# Altium schematic sheet Charger.SchDoc
size A4; Organization: Altium Limited; Address1: L3, 12a Rodborough Rd; Address2: Frenchs Forest; Address3: NSW; Address4: Australia 2086
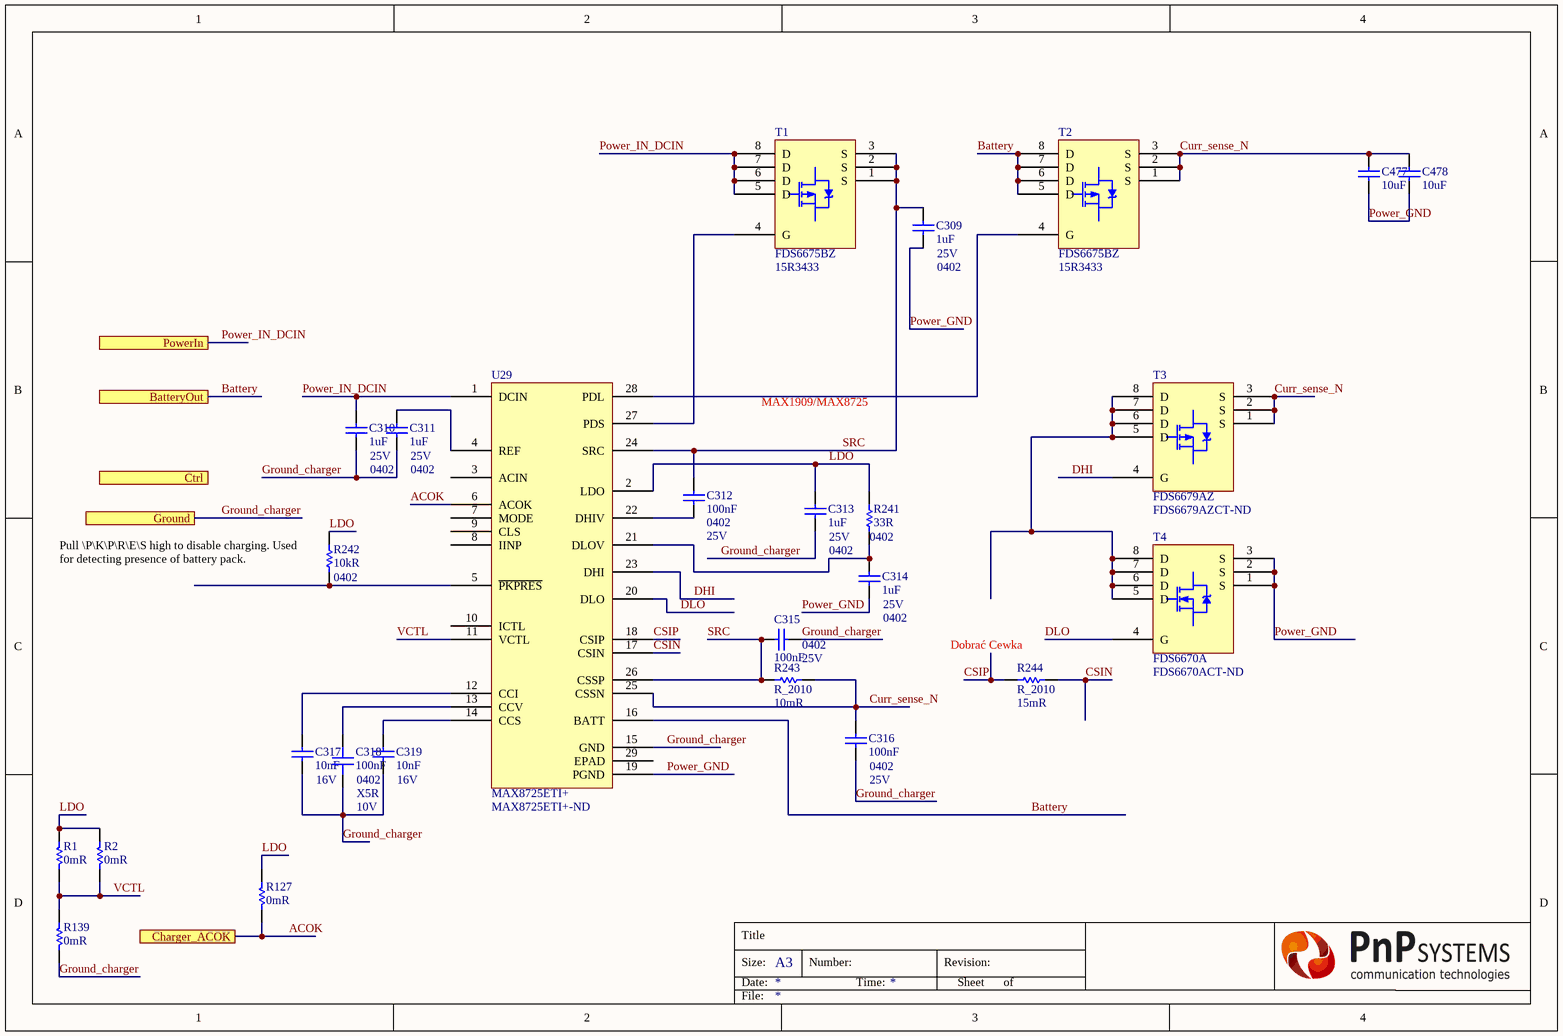
[diagram p0: Charger.SchDoc]

## Parts
C309  1uF  Case/Package: 0402  Voltage Rating: 25V  [CAP 0402/1005 RF]
C310  1uF  Case/Package: 0402  Voltage Rating: 25V  [CAP 0402/1005 RF]
C311  1uF  Case/Package: 0402  Voltage Rating: 25V  [CAP 0402/1005 RF]
C312  100nF  Case/Package: 0402  Voltage Rating: 25V  [CAP 0402/1005 RF]
C313  1uF  Case/Package: 0402  Voltage Rating: 25V  [CAP 0402/1005 RF]
C314  1uF  Case/Package: 0402  Voltage Rating: 25V  [CAP 0402/1005 RF]
C315  100nF  Case/Package: 0402  Voltage Rating: 25V  [CAP 0402/1005 RF]
C316  100nF  Case/Package: 0402  Voltage Rating: 25V  [CAP 0402/1005 RF]
C317  10nF  Voltage Rating (DC): 16V  [CAP 0201/0603 RF]
C318  100nF  Case/Package: 0402  Dielectric: X5R  Voltage Rating: 10V  [CAP 0402/1005 RF]
C319  10nF  Voltage Rating (DC): 16V  [CAP 0201/0603 RF]
C477  10uF  [CAP 1206/3216]
C478  10uF  [CAP 1206/3216]
R1  0mR  [RES 0402/1005 RF]
R2  0mR  [RES 0402/1005 RF]
R127  0mR  [RES 0402/1005 RF]
R139  0mR  [RES 0402/1005 RF]
R241  33R  Case/Package: 0402  [RES 0402/1005 RF]
R242  10kR  Case Code (Imperial): 0402  [RES 0402/1005 RF]
R243  R_2010  Parameter 1: 10mR  [RESC2010]
R244  R_2010  Parameter 1: 15mR  [RESC2010]
T1  FDS6675BZ  Supplier Part Number 1: 15R3433  [FDS6679AZ]
T2  FDS6675BZ  Supplier Part Number 1: 15R3433  [FDS6679AZ]
T3  FDS6679AZ  Supplier Part Number 1: FDS6679AZCT-ND  [FDS6679AZ]
T4  FDS6670A  Supplier Part Number 1: FDS6670ACT-ND  [FDS6679AZ]
U29  MAX8725ETI+  Supplier Part Number 1: MAX8725ETI+-ND  [MAX8725]

## Ports
BatteryOut, Charger_ACOK, Ctrl, Ground, PowerIn

## Nets
ACOK: R127.2 U29.6(ACOK) ; port Charger_ACOK
Battery: T2.5(D) T2.6(D) T2.7(D) T2.8(D) U29.16(BATT) ; port BatteryOut
CSIN: R244.1 U29.17(CSIN)
CSIP: R244.2 U29.18(CSIP)
Curr_sense_N: C316.2 C477.2 C478.2 R243.2 T2.1(S) T2.2(S) T2.3(S) T3.1(S) T3.2(S) T3.3(S) U29.25(CSSN)
DHI: T3.4(G) U29.23(DHI)
DLO: T4.4(G) U29.20(DLO)
Ground_charger: C310.1 C311.1 C313.1 C315.1 C316.1 C317.1 C318.1 C319.1 R139.2 U29.15(GND) ; port Ground
LDO: C313.2 R1.1 R2.1 R127.1 R241.2 R242.2 U29.2(LDO)
Power_GND: C309.1 C314.1 C477.1 C478.1 T4.1(S) T4.2(S) T4.3(S) U29.19(PGND)
Power_IN_DCIN: C310.2 T1.5(D) T1.6(D) T1.7(D) T1.8(D) U29.1(DCIN) ; port PowerIn
SRC: C309.2 C312.1 C315.2 R243.1 T1.1(S) T1.2(S) T1.3(S) U29.24(SRC) U29.26(CSSP)
VCTL: R1.2 R2.2 R139.1 U29.11(VCTL)
NetC311_2: C311.2 U29.4(REF)
NetC312_2: C312.2 U29.22(DHIV)
NetC314_2: C314.2 R241.1 U29.21(DLOV)
NetC317_2: C317.2 U29.12(CCI)
NetC318_2: C318.2 U29.13(CCV)
NetC319_2: C319.2 U29.14(CCS)
NetR242_1: R242.1 U29.5(~{PKPRES})
NetT1_4: T1.4(G) U29.27(PDS)
NetT2_4: T2.4(G) U29.28(PDL)
NetT3_5: T3.5(D) T3.6(D) T3.7(D) T3.8(D) T4.5(D) T4.6(D) T4.7(D) T4.8(D)

Not connected (* = marked no-connect by the designer): U29 3(ACIN) 7(MODE) 8(IINP) 9(CLS) 10(ICTL) 29(EPAD)

## Notes on the sheet
- MAX1909/MAX8725
- (near R242) Pull \P\K\P\R\E\S high to disable charging. Used for detecting presence of battery pack.
- (near R244) Dobrać Cewka
- Title
- Size:
- Date:
- A3
- Number:
- Time:
- Revision:
- Sheet
- of
- File:

## Library data of the parts
C309-C311 C313 C314 = Capacitor: MURATA - GRT155R61E105KE01D - SMD Multilayer Ceramic Capacitor, 1 µF, 25 V, 0402 [1005 Metric], ± 10%, X5R, GRT Series - SMD Multilayer Ceramic Capacitor, 1 µF, 25 V, 0402 [1005 Metric], ± 10%, X5R, GRT Series; Supplier 1: Digi-Key; Supplier Part Number 1: 490-12263-1-ND; Manufacturer: Murata; Manufacturer Part Number: GRT155R61E105KE01D; RoHS: Yes; Category: Ceramic Capacitors; Stock 1: 415681; Pricing 1: 1=0,18000, 10=0,12300, 100=0,06210, 500=0,04248, 1000=0,03758, 2500=0,03594, 5000=0,03268 (USD); Mount: Surface Mount; Case Code (Metric): 1005; Case Code (Imperial): 0402; Min Operating Temperature: -55°C; Max Operating Temperature: 85°C; Packaging: Tape and Reel; Capacitance: 1uF; Tolerance: 10%; Dielectric: X5R; Voltage Rating (DC): 25V; Length: 0.039inch; Width: 0.02inch; Thickness: 0.022inch; Ratings: AEC-Q200; ComponentLink1URL: http://www.farnell.com/datasheets/2165918.pdf?src-supplier=Farnell; ComponentLink1Description: http://www.farnell.com/datasheets/2165918.pdf?src-supplier=Farnell; ComponentLink2URL: http://search.murata.co.jp/Ceramy/image/img/A01X/G101/ENG/GRT155R61E105KE01-01.pdf?src-supplier=Digi-Key; ComponentLink2Description: http://search.murata.co.jp/Ceramy/image/img/A01X/G101/ENG/GRT155R61E105KE01-01.pdf?src-supplier=Digi-Key; ComponentLink3URL: http://www.farnell.com/datasheets/2165918.pdf?src-supplier=Element14; ComponentLink3Description: http://www.farnell.com/datasheets/2165918.pdf?src-supplier=Element14
C312 C315 C316 = Capacitor: Cap Ceramic 0.1uF 25V X7R 20% SMD 0402 125C Paper T/R; Manufacturer: Murata; Manufacturer Part Number: GRM155R71E104ME14D; Supplier 1: Digi-Key; Supplier Part Number 1: 490-13341-1-ND; RoHS: Yes; Category: Ceramic Capacitors; Stock 1: 57604; Pricing 1: 1=0,10000, 10=0,03800, 100=0,01680, 500=0,01198, 1000=0,00941, 2500=0,00855, 5000=0,00787 (USD); Mount: Surface Mount; Weight: 0.000212oz; Case Code (Metric): 1005; Material: Ceramic; Case Code (Imperial): 0402; Min Operating Temperature: -55°C; Max Operating Temperature: 125°C; Tolerance: 20%; Packaging: Tape and Reel; Capacitance: 100nF; Dielectric: X7R; Termination: SMD/SMT; Composition: Ceramic; Voltage Rating (DC): 25V; Package Quantity: 10000; Length: 1mm; Height: 0.5mm; Width: 0.5mm; Thickness: 0.022inch; Depth: 0.5mm; Lead Free: Lead Free; ComponentLink1URL: http://www.mouser.com/ds/2/281/c02e-2905.pdf?src-supplier=Mouser; ComponentLink1Description: http://www.mouser.com/ds/2/281/c02e-2905.pdf?src-supplier=Mouser; ComponentLink2URL: http://components.arrow.com/part/dataview/0323_07278596?src-supplier=Arrow+Europe; ComponentLink2Description: http://components.arrow.com/part/dataview/0323_07278596?src-supplier=Arrow+Europe; ComponentLink3URL: http://search.murata.co.jp/Ceramy/image/img/A01X/partnumbering_e_01.pdf?src-supplier=Digi-Key; ComponentLink3Description: http://search.murata.co.jp/Ceramy/image/img/A01X/partnumbering_e_01.pdf?src-supplier=Digi-Key; ComponentLink4URL: http://search.murata.co.jp/Ceramy/image/img/A01X/G101/ENG/GRM155R71E104ME14-01.pdf?src-supplier=Digi-Key; ComponentLink4Description: http://search.murata.co.jp/Ceramy/image/img/A01X/G101/ENG/GRM155R71E104ME14-01.pdf?src-supplier=Digi-Key
C317 C319 = Capacitor: CAP CER 10000PF 16V X7R 0201; Manufacturer: Murata; Manufacturer Part Number: GRM033R71C103KE14D; Tolerance: 10%; Supplier 1: Digi-Key; Supplier Part Number 1: 490-14453-1-ND; RoHS: No; Category: Ceramic Capacitors; Stock 1: 188777; Pricing 1: 1=0,10000, 10=0,01900, 100=0,00870, 500=0,00620, 1000=0,00487, 2500=0,00443, 5000=0,00407 (USD); Dielectric: X7R; Capacitance: 10nF; Length: 600um; Width: 300um; Thickness: 300um; ComponentLink1URL: http://www.farnell.com/datasheets/2722745.pdf?src-supplier=Farnell; ComponentLink1Description: http://www.farnell.com/datasheets/2722745.pdf?src-supplier=Farnell; ComponentLink2URL: http://www.farnell.com/datasheets/2722745.pdf?src-supplier=Newark; ComponentLink2Description: http://www.farnell.com/datasheets/2722745.pdf?src-supplier=Newark; ComponentLink3URL: http://www.farnell.com/datasheets/2722745.pdf?src-supplier=Element14; ComponentLink3Description: http://www.farnell.com/datasheets/2722745.pdf?src-supplier=Element14; ComponentLink4URL: http://search.murata.co.jp/Ceramy/image/img/A01X/G101/ENG/GRM033R71C103KE14-01.pdf?src-supplier=Digi-Key; ComponentLink4Description: http://search.murata.co.jp/Ceramy/image/img/A01X/G101/ENG/GRM033R71C103KE14-01.pdf?src-supplier=Digi-Key
C318 = Capacitor: Manufacturer: Yageo; Manufacturer Part Number: CC0402KRX5R6BB104; Tolerance: 10%; Dissipation Factor: 5%; Insulation Resistance: 10GR; Supplier 1: Digi-Key; Supplier Part Number 1: 311-1336-1-ND; Stock 1: 8753233; Pricing 1: 1 = 0,10000, 10 = 0,03000, 100 = 0,01350, 500 = 0,00966, 1000 = 0,00759, 2500 = 0,00690, 5000 = 0,00635 (USD); RoHS: Yes; Mount: Surface Mount; Number of Pins: 2; Case Code (Imperial): 0402; Case Code (Metric): 1005; Min Operating Temperature: -55°C; Max Operating Temperature: 85°C; Capacitance: 100nF; Packaging: Tape and Reel; Package Quantity: 1; Termination: SMD/SMT; Voltage Rating (DC): 10V; Length: 1mm; Height: 0.5mm; Depth: 0.5mm; Width: 0.02inch; Thickness: 0.022inch; Radiation Hardening: No; REACH SVHC: No SVHC; Lead Free: Lead Free; Halogen Free: Halogen Free; ComponentLink1URL: https://datasheet.ciiva.com/144/mlccorderingcode-144028.pdf?src-supplier=Digi-Key; ComponentLink1Description: https://datasheet.ciiva.com/144/mlccorderingcode-144028.pdf?src-supplier=Digi-Key; ComponentLink2URL: https://datasheet.ciiva.com/144/mlccorderingcode-144029.pdf?src-supplier=Digi-Key; ComponentLink2Description: https://datasheet.ciiva.com/144/mlccorderingcode-144029.pdf?src-supplier=Digi-Key; ComponentLink3URL: https://datasheet.ciiva.com/144/mlccorderingcode-144030.pdf?src-supplier=Digi-Key; ComponentLink3Description: https://datasheet.ciiva.com/144/mlccorderingcode-144030.pdf?src-supplier=Digi-Key; ComponentLink4URL: https://datasheet.ciiva.com/11587/upy-gphc-x5r-4v-to-50v-12-11587302.pdf?src-supplier=Avnet; ComponentLink4Description: https://datasheet.ciiva.com/11587/upy-gphc-x5r-4v-to-50v-12-11587302.pdf?src-supplier=Avnet; ComponentLink5URL: https://datasheet.ciiva.com/7978/1359354-7978091.pdf?src-supplier=Element14; ComponentLink5Description: https://datasheet.ciiva.com/7978/1359354-7978091.pdf?src-supplier=Element14; ComponentLink6URL: https://datasheet.ciiva.com/16624/upy-gphc-x5r-4v-to-50v-12-16624732.pdf?src-supplier=Avnet+Europe; ComponentLink6Description: https://datasheet.ciiva.com/16624/upy-gphc-x5r-4v-to-50v-12-16624732.pdf?src-supplier=Avnet+Europe
C477 C478 = Capacitor: Manufacturer 1: Murata; Manufacturer Part Number 1: GRM31CR71E106MA12L; Tolerance: 20%; Dielectric: X7R; Voltage Rating: 25V; Supplier 1: Digi-Key; Supplier Part Number 1: 490-6519-1-ND; Stock 1: 9864; Pricing 1: 1=0,79000, 10=0,59800, 100=0,42750, 500=0,33098, 1000=0,28501 (USD); RoHS: Yes; Mount: Surface Mount; Case/Package: 1206; Case Code (Metric): 3216; Case Code (Imperial): 1206; Min Operating Temperature: -55°C; Max Operating Temperature: 125°C; Capacitance: 10uF; Package Quantity: 1; Packaging: Tape and Reel; Termination: SMD/SMT; Voltage: 25V; Voltage Rating (DC): 25V; Length: 3.2mm; Height: 1.6mm; Width: 0.063inch; Thickness: 0.071inch; Depth: 1.6mm; Radiation Hardening: No; REACH SVHC: No SVHC; Lead Free: Lead Free; ComponentLink1URL: https://datasheet.ciiva.com/11607/product-11607561.pdf?src-supplier=Avnet; ComponentLink1Description: https://datasheet.ciiva.com/11607/product-11607561.pdf?src-supplier=Avnet; ComponentLink2URL: https://datasheet.ciiva.com/5412/product-5412861.pdf?src-supplier=Mouser; ComponentLink2Description: https://datasheet.ciiva.com/5412/product-5412861.pdf?src-supplier=Mouser; ComponentLink3URL: https://datasheet.ciiva.com/6264/partnumbering-e-01-6264463.pdf?src-supplier=Digi-Key; ComponentLink3Description: https://datasheet.ciiva.com/6264/partnumbering-e-01-6264463.pdf?src-supplier=Digi-Key
R1 R2 R127 R139 = Resistor: Manufacturer 1: Yageo; Manufacturer Part Number 1: RC0402JR-070RL; Power Rating: 62.5mW; Tolerance: 5%; Voltage Rating: 50V; Max Power Dissipation: 63mW; Temperature Coefficient: 200ppm/°C; Supplier 1: Digi-Key; Supplier Part Number 1: 311-0.0JRCT-ND; Stock 1: 69822252; Pricing 1: 1=0.10000, 10=0.01200, 25=0.00920, 50=0.00680, 100=0.00510, 250=0.00388, 500=0.00308, 1000=0.00227, 5000=0.00163 (USD); RoHS: Yes; Case/Package: 0402; Contact Plating: Tin,Matte; Case Code (Metric): 1005; Case Code (Imperial): 0402; Min Operating Temperature: -55°C; Max Operating Temperature: 155°C; Resistance: 0mR; Packaging: Tape and Reel; Composition: Thick Film; Package Quantity: 1; Number of Terminations: 2; Termination: SMD/SMT; Military Standard: Not; Features: Moisture Resistant; Length: 1mm; Height: 0.016inch; Width: 0.02inch; Depth: 0.5mm; Radiation Hardening: No; REACH SVHC: Unknown; Lead Free: Lead Free; ComponentLink1URL: https://datasheet.ciiva.com/2452/pyu-rc0402-51-rohs-l-6-2452608.pdf?src-supplier=Digi-Key; ComponentLink1Description: https://datasheet.ciiva.com/2452/pyu-rc0402-51-rohs-l-6-2452608.pdf?src-supplier=Digi-Key; ComponentLink2URL: https://datasheet.ciiva.com/11808/0900766b80c66297-11808195.pdf?src-supplier=RSComponents; ComponentLink2Description: https://datasheet.ciiva.com/11808/0900766b80c66297-11808195.pdf?src-supplier=RSComponents; ComponentLink3URL: https://datasheet.ciiva.com/2452/pyu-r-int-thick-7-2452609.pdf?src-supplier=Digi-Key; ComponentLink3Description: https://datasheet.ciiva.com/2452/pyu-r-int-thick-7-2452609.pdf?src-supplier=Digi-Key; ComponentLink4URL: https://datasheet.ciiva.com/22747/1018594-22747515.pdf?src-supplier=Element14; ComponentLink4Description: https://datasheet.ciiva.com/22747/1018594-22747515.pdf?src-supplier=Element14; ComponentLink5URL: https://datasheet.ciiva.com/7983/1018594-7983535.pdf?src-supplier=Element14; ComponentLink5Description: https://datasheet.ciiva.com/7983/1018594-7983535.pdf?src-supplier=Element14; ComponentLink6URL: https://datasheet.ciiva.com/2452/pyu-r-int-thick-7-2452610.pdf?src-supplier=Digi-Key; ComponentLink6Description: https://datasheet.ciiva.com/2452/pyu-r-int-thick-7-2452610.pdf?src-supplier=Digi-Key; ComponentLink7URL: https://datasheet.ciiva.com/8896/pyu-rc0402-51-rohs-l-6-8896201.pdf?src-supplier=Avnet; ComponentLink7Description: https://datasheet.ciiva.com/8896/pyu-rc0402-51-rohs-l-6-8896201.pdf?src-supplier=Avnet; ComponentLink8URL: https://datasheet.ciiva.com/28386/pyu-rc0402-51-rohs-l-6-28386633.pdf?src-supplier=Avnet+Europe; ComponentLink8Description: https://datasheet.ciiva.com/28386/pyu-rc0402-51-rohs-l-6-28386633.pdf?src-supplier=Avnet+Europe; ComponentLink9URL: https://datasheet.ciiva.com/15189/getdatasheetpartid-326379-15189533.pdf?src-supplier=Verical; ComponentLink9Description: https://datasheet.ciiva.com/15189/getdatasheetpartid-326379-15189533.pdf?src-supplier=Verical
R241 = Resistor: Res Thick Film 0402 33 Ohm 1% 0.063W(1/16W) ±100ppm/C Epoxy Pad SMD T/R; Manufacturer: Yageo; Manufacturer Part Number: RC0402FR-0733RL; Power Rating: 62.5mW; Voltage Rating: 50V; Temperature Coefficient: 100ppm/°C; Supplier 1: Digi-Key; Supplier Part Number 1: 311-33.0LRCT-ND; RoHS: Yes; Category: Chip SMD Resistors; Stock 1: 3970054; Pricing 1: 1=0,10000, 10=0,01600, 100=0,00640, 1000=0,00289, 2500=0,00251, 5000=0,00207 (USD); Number of Pins: 2; Case Code (Imperial): 0402; Case Code (Metric): 1005; Min Operating Temperature: -55°C; Max Operating Temperature: 155°C; Resistance: 33R; Tolerance: 1%; Packaging: Tape and Reel; Termination: SMD/SMT; Composition: Thick Film; Military Standard: Not; Voltage Rating (DC): 50V; Package Quantity: 10000; Length: 1mm; Height: 0.35mm; Depth: 0.5mm; Width: 0.5mm; REACH SVHC: Unknown; Lead Free: Lead Free; ComponentLink1URL: https://datasheet.ciiva.com/11819/0900766b80c66297-11819487.pdf?src-supplier=RSComponents; ComponentLink1Description: https://datasheet.ciiva.com/11819/0900766b80c66297-11819487.pdf?src-supplier=RSComponents; ComponentLink2URL: https://datasheet.ciiva.com/15189/getdatasheetpartid-329253-15189431.pdf?src-supplier=Verical; ComponentLink2Description: https://datasheet.ciiva.com/15189/getdatasheetpartid-329253-15189431.pdf?src-supplier=Verical; ComponentLink3URL: https://datasheet.ciiva.com/24070/pyu-rc0402-51-rohs-l-6-r-8721-24070077.pdf?src-supplier=Mouser; ComponentLink3Description: https://datasheet.ciiva.com/24070/pyu-rc0402-51-rohs-l-6-r-8721-24070077.pdf?src-supplier=Mouser; ComponentLink4URL: https://datasheet.ciiva.com/7849/1018594-7849966.pdf?src-supplier=Element14; ComponentLink4Description: https://datasheet.ciiva.com/7849/1018594-7849966.pdf?src-supplier=Element14; ComponentLink5URL: https://datasheet.ciiva.com/7849/1018594-7849967.pdf?src-supplier=Element14; ComponentLink5Description: https://datasheet.ciiva.com/7849/1018594-7849967.pdf?src-supplier=Element14; ComponentLink6URL: https://datasheet.ciiva.com/17070/pyu-rc0402-51-rohs-l-6-r-17070335.pdf?src-supplier=Future+Electronics; ComponentLink6Description: https://datasheet.ciiva.com/17070/pyu-rc0402-51-rohs-l-6-r-17070335.pdf?src-supplier=Future+Electronics
R242 = Resistor: RES 10K OHM 0.1% 1/16W 0402; Manufacturer: Stackpole Electronics; Manufacturer Part Number: RNCF0402BTE10K0; Max Power Dissipation: 63mW; Temperature Coefficient: 25ppm/°C; Supplier 1: Digi-Key; Supplier Part Number 1: RNCF0402BTE10K0CT-ND; RoHS: Yes; Category: Chip SMD Resistors; Stock 1: 121200; Pricing 1: 1=0,42000, 10=0,29900, 100=0,11950, 1000=0,05891, 2500=0,05457, 5000=0,04938 (USD); Mount: Surface Mount; Case/Package: 0402; Case Code (Metric): 1005; Contact Plating: Tin,Matte; Min Operating Temperature: -55°C; Max Operating Temperature: 155°C; Packaging: Tape and Reel; Resistance: 10kR; Tolerance: 0.1%; Package Quantity: 10000; Composition: Thin Film; Number of Terminations: 2; Features: Moisture Resistant; Length: 0.039inch; Height: 0.016inch; Width: 0.02inch; Radiation Hardening: No; ComponentLink1URL: https://www.seielect.com/Catalog/SEI-rncf.pdf?src-supplier=Avnet; ComponentLink1Description: https://www.seielect.com/Catalog/SEI-rncf.pdf?src-supplier=Avnet; ComponentLink2URL: https://www.seielect.com/catalog/SEI-Packaging.pdf?src-supplier=Digi-Key; ComponentLink2Description: https://www.seielect.com/catalog/SEI-Packaging.pdf?src-supplier=Digi-Key
R243 = R_2010: RES 0.01 OHM 1% 1/2W 2010; Manufacturer: Vishay Dale; Manufacturer Part Number: WSL2010R0100FEA; Power Rating: 500mW; Voltage Rating: 70mV; Temperature Coefficient: 75ppm/°C; Parameter 2: =Package / Case; Supplier 1: Newark; Supplier Part Number 1: 26AC5229; RoHS: Yes; Category: Chip SMD Resistors; Mount: Surface Mount; Case/Package: 2010; Number of Pins: 2; Weight: 0.001372oz; Case Code (Imperial): 2010; Case Code (Metric): 5025; Contact Plating: Tin,Matte; Min Operating Temperature: -65°C; Max Operating Temperature: 170°C; Packaging: Tape and Reel; Resistance: 10mR; Tolerance: 1%; Package Quantity: 4000; Voltage Rating (DC): 70mV; Termination: SMD/SMT; Composition: Metal Strip,Metal Film; Military Standard: Not; Length: 5.08mm; Height: 0.635mm; Width: 2.5mm; Depth: 2.54mm; Radiation Hardening: No; REACH SVHC: Unknown; Lead Free: Lead Free; ComponentLink1URL: https://datasheet.ciiva.com/36857/442550-36857510.pdf?src-supplier=Element14; ComponentLink1Description: https://datasheet.ciiva.com/36857/442550-36857510.pdf?src-supplier=Element14; ComponentLink2URL: https://datasheet.ciiva.com/16771/70201098-16771224.pdf?src-supplier=Allied+Electronics; ComponentLink2Description: https://datasheet.ciiva.com/16771/70201098-16771224.pdf?src-supplier=Allied+Electronics; ComponentLink3URL: https://datasheet.ciiva.com/17190/wsl-17190024.pdf?src-supplier=Avnet+Europe; ComponentLink3Description: https://datasheet.ciiva.com/17190/wsl-17190024.pdf?src-supplier=Avnet+Europe; ComponentLink4URL: https://datasheet.ciiva.com/9049/wsl-9049438.pdf?src-supplier=Avnet; ComponentLink4Description: https://datasheet.ciiva.com/9049/wsl-9049438.pdf?src-supplier=Avnet
R244 = R_2010: RES SMD 15 MOHM 1% 1W 2010; Manufacturer: Vishay Dale; Manufacturer Part Number: WSL2010R0150FEA18; Temperature Coefficient: 75ppm/°C; Parameter 2: =Package / Case; Supplier 1: Digi-Key; Supplier Part Number 1: WSLF-.015CT-ND; RoHS: Yes; Category: Chip SMD Resistors; Stock 1: 9944; Pricing 1: 1=1,31000, 10=1,16400, 25=1,07000, 50=0,97600, 100=0,84460, 250=0,71320, 500=0,60060, 1000=0,49925 (USD); Mount: Surface Mount; Case/Package: 2010; Case Code (Imperial): 2010; Case Code (Metric): 5025; Contact Plating: Tin,Matte; Min Operating Temperature: -65°C; Max Operating Temperature: 170°C; Tolerance: 1%; Power Rating: 1W; Resistance: 15mR; Packaging: Tape and Reel; Package Quantity: 4000; Termination: SMD/SMT; Composition: Metal Strip; Length: 5mm; Height: 0.635mm; Width: 2.5mm; Depth: 2.54mm; Radiation Hardening: No; REACH SVHC: Unknown; Lead Free: Lead Free; ComponentLink1URL: https://datasheet.ciiva.com/9039/wslhigh-9039048.pdf?src-supplier=Avnet; ComponentLink1Description: https://datasheet.ciiva.com/9039/wslhigh-9039048.pdf?src-supplier=Avnet; ComponentLink2URL: https://datasheet.ciiva.com/46448/wsl-46448618.pdf?src-supplier=Element14; ComponentLink2Description: https://datasheet.ciiva.com/46448/wsl-46448618.pdf?src-supplier=Element14
T1 T2 = FDS6675BZ: ON SEMICONDUCTOR - FDS6675BZ - P CHANNEL MOSFET, -30V, -11A; Manufacturer: ON Semiconductor / Fairchild; Nominal Vgs: -2V; Rise Time: 7.8ns; Input Capacitance: 2.47nF; Max Power Dissipation: 2.5W; Number of Elements: 1; Rds On Max: 13mR; Continuous Drain Current (ID): 11A; Fall Time: 60ns; Drain to Source Resistance: 10.8mR; Turn-Off Delay Time: 120ns; Drain to Source Voltage (Vdss): 30V; Turn-On Delay Time: 3ns; Element Configuration: Single; Gate to Source Voltage (Vgs): 25V; On-State Resistance: 21.8MR; Supplier 1: Newark; Manufacturer Part Number: FDS6675BZ; RoHS: Yes; Category: Integrated Circuits (ICs); Mount: Surface Mount; Case/Package: SOIC; Number of Pins: 8; Weight: 0.13g; Contact Plating: Tin,Matte; Min Operating Temperature: -55°C; Max Operating Temperature: 150°C; Packaging: Tape and Reel; Package Quantity: 1; Dual Supply Voltage: -30V; Power Dissipation: 2.5W; Threshold Voltage: -2V; Termination: SMD/SMT; Drain to Source Breakdown Voltage: -30V; Length: 5mm; Height: 1.5mm; Width: 4mm; Radiation Hardening: No; REACH SVHC: No SVHC; Lead Free: Lead Free; ComponentLink1URL: https://datasheet.ciiva.com/4440/fds6675bz-52181-4440034.pdf?src-supplier=Mouser; ComponentLink1Description: https://datasheet.ciiva.com/4440/fds6675bz-52181-4440034.pdf?src-supplier=Mouser; ComponentLink2URL: https://datasheet.ciiva.com/15137/getdatasheetpartid-35337-15137063.pdf?src-supplier=Verical; ComponentLink2Description: https://datasheet.ciiva.com/15137/getdatasheetpartid-35337-15137063.pdf?src-supplier=Verical; ComponentLink3URL: https://datasheet.ciiva.com/8114/fds6675bz-8114586.pdf?src-supplier=Avnet; ComponentLink3Description: https://datasheet.ciiva.com/8114/fds6675bz-8114586.pdf?src-supplier=Avnet; ComponentLink4URL: https://datasheet.ciiva.com/22681/669187-22681932.pdf?src-supplier=Element14; ComponentLink4Description: https://datasheet.ciiva.com/22681/669187-22681932.pdf?src-supplier=Element14; ComponentLink5URL: https://datasheet.ciiva.com/6367/fds6675bz-6367887.pdf?src-supplier=Digi-Key; ComponentLink5Description: https://datasheet.ciiva.com/6367/fds6675bz-6367887.pdf?src-supplier=Digi-Key; ComponentLink6URL: https://datasheet.ciiva.com/26252/fds6675bz-26252742.pdf?src-supplier=Avnet+Europe; ComponentLink6Description: https://datasheet.ciiva.com/26252/fds6675bz-26252742.pdf?src-supplier=Avnet+Europe; ComponentLink7URL: https://datasheet.ciiva.com/6367/fds6675bz-6367885.pdf?src-supplier=Digi-Key; ComponentLink7Description: https://datasheet.ciiva.com/6367/fds6675bz-6367885.pdf?src-supplier=Digi-Key; ComponentLink8URL: https://datasheet.ciiva.com/6367/fds6675bz-6367886.pdf?src-supplier=Digi-Key; ComponentLink8Description: https://datasheet.ciiva.com/6367/fds6675bz-6367886.pdf?src-supplier=Digi-Key
T3 = FDS6679AZ: MOSFET P-CH 30V 13A 8-SOIC; Manufacturer: ON Semiconductor / Fairchild; Max Power Dissipation: 2.5W; Number of Elements: 1; Rise Time: 15ns; Nominal Vgs: -1.9V; Rds On Max: 9.3mR; Input Capacitance: 3.845nF; Fall Time: 92ns; Turn-Off Delay Time: 210ns; Turn-On Delay Time: 13ns; Element Configuration: Single; Drain to Source Breakdown Voltage: -30V; Gate to Source Voltage (Vgs): 25V; Current Rating: -13A; Supplier 1: Digi-Key; Manufacturer Part Number: FDS6679AZ; RoHS: Yes; Category: MOSFETs; Stock 1: 26767; Pricing 1: 1=0,87000, 10=0,76600, 100=0,52260, 500=0,43666, 1000=0,37163 (USD); Mount: Surface Mount; Case/Package: SOIC; Number of Pins: 8; Weight: 0.13g; Contact Plating: Tin,Matte; Min Operating Temperature: -55°C; Max Operating Temperature: 150°C; Packaging: Tape and Reel; Package Quantity: 1; Continuous Drain Current (ID): 13A; Power Dissipation: 2.5W; Drain to Source Resistance: 9.3mR; Drain to Source Voltage (Vdss): 30V; Threshold Voltage: -1.9V; Voltage Rating (DC): -30V; On-State Resistance: 9.3MR; Length: 5mm; Height: 1.5mm; Width: 4mm; Radiation Hardening: No; REACH SVHC: No SVHC; Lead Free: Lead Free; ComponentLink1URL: https://datasheet.ciiva.com/1256/356284-1256072.pdf?src-supplier=Newark; ComponentLink1Description: https://datasheet.ciiva.com/1256/356284-1256072.pdf?src-supplier=Newark; ComponentLink2URL: https://datasheet.ciiva.com/4439/fds6679az-52245-4439449.pdf?src-supplier=Mouser; ComponentLink2Description: https://datasheet.ciiva.com/4439/fds6679az-52245-4439449.pdf?src-supplier=Mouser; ComponentLink3URL: https://datasheet.ciiva.com/15137/getdatasheetpartid-60188-15137255.pdf?src-supplier=Verical; ComponentLink3Description: https://datasheet.ciiva.com/15137/getdatasheetpartid-60188-15137255.pdf?src-supplier=Verical; ComponentLink4URL: https://datasheet.ciiva.com/22681/356284-22681995.pdf?src-supplier=Element14; ComponentLink4Description: https://datasheet.ciiva.com/22681/356284-22681995.pdf?src-supplier=Element14; ComponentLink5URL: https://datasheet.ciiva.com/932/fds6679az-932957.pdf?src-supplier=Digi-Key; ComponentLink5Description: https://datasheet.ciiva.com/932/fds6679az-932957.pdf?src-supplier=Digi-Key; ComponentLink6URL: https://datasheet.ciiva.com/26252/fds6679az-26252741.pdf?src-supplier=Avnet+Europe; ComponentLink6Description: https://datasheet.ciiva.com/26252/fds6679az-26252741.pdf?src-supplier=Avnet+Europe; ComponentLink7URL: https://datasheet.ciiva.com/16798/fds6679az-16798135.pdf?src-supplier=Future+Electronics; ComponentLink7Description: https://datasheet.ciiva.com/16798/fds6679az-16798135.pdf?src-supplier=Future+Electronics; ComponentLink8URL: https://datasheet.ciiva.com/932/fds6679az-932955.pdf?src-supplier=Digi-Key; ComponentLink8Description: https://datasheet.ciiva.com/932/fds6679az-932955.pdf?src-supplier=Digi-Key; ComponentLink9URL: https://datasheet.ciiva.com/11175/fds6679az-11175195.pdf?src-supplier=Avnet; ComponentLink9Description: https://datasheet.ciiva.com/11175/fds6679az-11175195.pdf?src-supplier=Avnet; ComponentLink10URL: https://datasheet.ciiva.com/932/fds6679az-932956.pdf?src-supplier=Digi-Key; ComponentLink10Description: https://datasheet.ciiva.com/932/fds6679az-932956.pdf?src-supplier=Digi-Key; ComponentLink11URL: https://datasheet.ciiva.com/22681/356284-22681996.pdf?src-supplier=Element14; ComponentLink11Description: https://datasheet.ciiva.com/22681/356284-22681996.pdf?src-supplier=Element14; ComponentLink12URL: https://datasheet.ciiva.com/22681/356284-22681933.pdf?src-supplier=Element14; ComponentLink12Description: https://datasheet.ciiva.com/22681/356284-22681933.pdf?src-supplier=Element14; ComponentLink13URL: https://datasheet.ciiva.com/8114/fds6679az-8114590.pdf?src-supplier=Avnet; ComponentLink13Description: https://datasheet.ciiva.com/8114/fds6679az-8114590.pdf?src-supplier=Avnet
T4 = FDS6670A: Trans MOSFET N-CH 30V 13A 8-Pin SOIC T/R; Manufacturer: ON Semiconductor / Fairchild; Rise Time: 13ns; Nominal Vgs: 1.8V; Rds On Max: 8mR; Input Capacitance: 2.22nF; Number of Elements: 1; Max Power Dissipation: 2.5W; Turn-Off Delay Time: 40ns; Turn-On Delay Time: 15ns; Element Configuration: Single; Gate to Source Voltage (Vgs): 20V; Supplier 1: Digi-Key; Manufacturer Part Number: FDS6670A; RoHS: Yes; Category: MOSFETs; Stock 1: 7784; Pricing 1: 1=0,79000, 10=0,69500, 100=0,47390, 500=0,39600, 1000=0,33702 (USD); Mount: Surface Mount; Case/Package: SOIC; Number of Pins: 8; Weight: 0.13g; Min Operating Temperature: -55°C; Max Operating Temperature: 150°C; Packaging: Tape and Reel; Package Quantity: 2500; Dual Supply Voltage: 30V; Continuous Drain Current (ID): 13A; Drain to Source Breakdown Voltage: 30V; Fall Time: 13ns; Drain to Source Resistance: 8mR; Power Dissipation: 2.5W; Drain to Source Voltage (Vdss): 30V; Termination: SMD/SMT; Threshold Voltage: 1.8V; Voltage Rating (DC): 30V; Current Rating: 13A; On-State Resistance: 8MR; Length: 5mm; Height: 1.5mm; Width: 4mm; Radiation Hardening: No; REACH SVHC: No SVHC; Lead Free: Lead Free; ComponentLink1URL: https://datasheet.ciiva.com/8115/fds6670a-8115808.pdf?src-supplier=Avnet; ComponentLink1Description: https://datasheet.ciiva.com/8115/fds6670a-8115808.pdf?src-supplier=Avnet; ComponentLink2URL: https://datasheet.ciiva.com/15137/getdatasheetpartid-42473-15137120.pdf?src-supplier=Verical; ComponentLink2Description: https://datasheet.ciiva.com/15137/getdatasheetpartid-42473-15137120.pdf?src-supplier=Verical; ComponentLink3URL: https://datasheet.ciiva.com/34301/893700-34301690.pdf?src-supplier=Jameco; ComponentLink3Description: https://datasheet.ciiva.com/34301/893700-34301690.pdf?src-supplier=Jameco; ComponentLink4URL: https://datasheet.ciiva.com/4439/fds6670a-80003-4439889.pdf?src-supplier=Mouser; ComponentLink4Description: https://datasheet.ciiva.com/4439/fds6670a-80003-4439889.pdf?src-supplier=Mouser; ComponentLink5URL: https://datasheet.ciiva.com/8115/fds6670a-8115814.pdf?src-supplier=Avnet; ComponentLink5Description: https://datasheet.ciiva.com/8115/fds6670a-8115814.pdf?src-supplier=Avnet; ComponentLink6URL: https://datasheet.ciiva.com/7968/245230-7968170.pdf?src-supplier=Element14; ComponentLink6Description: https://datasheet.ciiva.com/7968/245230-7968170.pdf?src-supplier=Element14; ComponentLink7URL: https://datasheet.ciiva.com/6382/fds6670a-6382175.pdf?src-supplier=Digi-Key; ComponentLink7Description: https://datasheet.ciiva.com/6382/fds6670a-6382175.pdf?src-supplier=Digi-Key; ComponentLink8URL: https://datasheet.ciiva.com/16790/fds6670a-16790501.pdf?src-supplier=Future+Electronics; ComponentLink8Description: https://datasheet.ciiva.com/16790/fds6670a-16790501.pdf?src-supplier=Future+Electronics; ComponentLink9URL: https://datasheet.ciiva.com/6382/fds6670a-6382172.pdf?src-supplier=Digi-Key; ComponentLink9Description: https://datasheet.ciiva.com/6382/fds6670a-6382172.pdf?src-supplier=Digi-Key
U29 = MAX8725ETI+: Battery Charger Lead-Acid/Li-Ion/Li-Pol/NiCD/NiMH 4000mA 17.65V 28-Pin TQFN EP; Manufacturer: Maxim Integrated; Output Current: 4A; Number of Cells: 4; Operating Supply Current: 2.7mA; Operating Supply Voltage: 28V; Supplier 1: Digi-Key; Manufacturer Part Number: MAX8725ETI+; Category: Battery Management; Stock 1: 547; Pricing 1: 1=9,02000, 10=8,29100, 25=7,94760, 100=6,65880, 250=6,44400 (USD); Mount: Surface Mount; Number of Pins: 28; Min Operating Temperature: -40°C; Max Operating Temperature: 85°C; Output Voltage: 17.65V; Packaging: Rail/Tube; Package Quantity: 60; Max Charge Current: 4A; Battery Pack Voltage: 17.65V; Max Supply Voltage: 28V; Radiation Hardening: No; Lead Free: Lead Free; ComponentLink1URL: https://datasheet.ciiva.com/4873/max1909-max8725-98075-4873665.pdf?src-supplier=Mouser; ComponentLink1Description: https://datasheet.ciiva.com/4873/max1909-max8725-98075-4873665.pdf?src-supplier=Mouser; ComponentLink2URL: https://datasheet.ciiva.com/1137/77654-1137683.pdf?src-supplier=Element14; ComponentLink2Description: https://datasheet.ciiva.com/1137/77654-1137683.pdf?src-supplier=Element14; ComponentLink3URL: https://datasheet.ciiva.com/26875/max8725eti-26875599.pdf?src-supplier=IIIC; ComponentLink3Description: https://datasheet.ciiva.com/26875/max8725eti-26875599.pdf?src-supplier=IIIC; ComponentLink4URL: https://datasheet.ciiva.com/3213/max1909-max8725-3213382.pdf?src-supplier=Avnet; ComponentLink4Description: https://datasheet.ciiva.com/3213/max1909-max8725-3213382.pdf?src-supplier=Avnet; ComponentLink5URL: https://datasheet.ciiva.com/17298/max1909-max8725-17298810.pdf?src-supplier=Avnet+Europe; ComponentLink5Description: https://datasheet.ciiva.com/17298/max1909-max8725-17298810.pdf?src-supplier=Avnet+Europe; ComponentLink6URL: https://datasheet.ciiva.com/1140/77654-1140236.pdf?src-supplier=Farnell; ComponentLink6Description: https://datasheet.ciiva.com/1140/77654-1140236.pdf?src-supplier=Farnell; ComponentLink7URL: http://datasheet.octopart.com/MAX8725ETI%2B-Maxim-datasheet-5347532.pdf?src-supplier=Element14; ComponentLink7Description: http://datasheet.octopart.com/MAX8725ETI%2B-Maxim-datasheet-5347532.pdf?src-supplier=Element14; ComponentLink8URL: http://datasheet.octopart.com/MAX8725ETI%2B-Dallas-Semiconductor-datasheet-13724859.pdf; ComponentLink8Description: http://datasheet.octopart.com/MAX8725ETI%2B-Dallas-Semiconductor-datasheet-13724859.pdf; ComponentLink9URL: http://datasheet.octopart.com/MAX8725ETI%2B-Maxim-datasheet-122681.pdf?src-supplier=Digi-Key; ComponentLink9Description: http://datasheet.octopart.com/MAX8725ETI%2B-Maxim-datasheet-122681.pdf?src-supplier=Digi-Key; ComponentLink10URL: http://datasheet.octopart.com/MAX8725ETI%2B-Maxim-Integrated-datasheet-15934611.pdf?src-supplier=IIIC; ComponentLink10Description: http://datasheet.octopart.com/MAX8725ETI%2B-Maxim-Integrated-datasheet-15934611.pdf?src-supplier=IIIC